# Altium schematic sheet SFY_ADA_4G_02_MODEM_1.SchDoc: MODEM 1/2
size 297 x 209 mm; SPICEModelCacheSIYKSXFI: <root> / <DocumentId>SIYKSXFI</DocumentId> / <CacheFrame Number="0"> / <Model Name="0603_150060gs55040" Kind="CKT"> / <Text>***************************** / .subckt 0603_150060GS55040 1 2 / D1 1 2 SMCD / .MODEL SMCD D / + IS=406.49E-12 / + N=4.8627 / + RS=4.1370 / + IKF=13.914E-6 / + CJO=1.0000E-12 / + M=.3333 / + VJ=.75 / + BV=5 / + IBV=100.00E-6 / + TT=5.0000E-9 / .ends</Text> / </Model> / </CacheFrame> / </root>
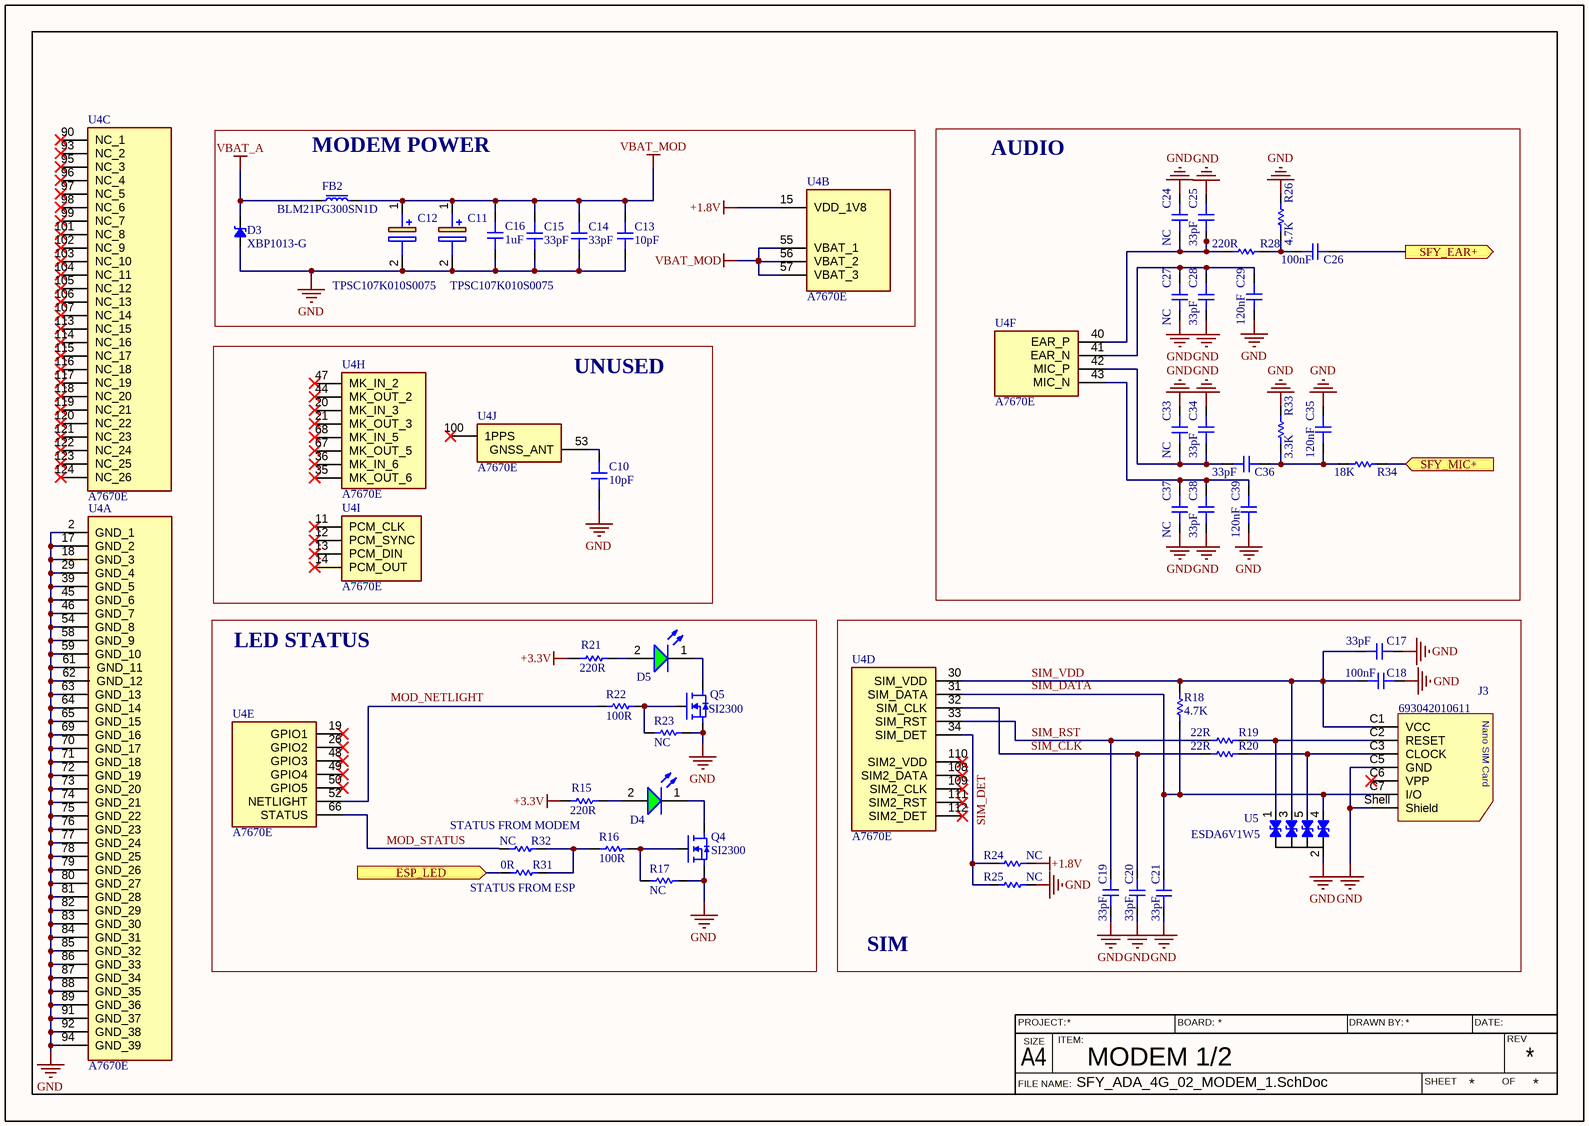
[diagram p0: SFY_ADA_4G_02_MODEM_1.SchDoc]

## Parts
C10  10pF  [C_0603_H_0.8_M]
C11  TPSC107K010S0075  [CAPPM6032X280N]
C12  TPSC107K010S0075  [CAPPM6032X280N]
C13  10pF  [C_0603_H_0.8_M]
C14  33pF  [C_0603_H_0.8_M]
C15  33pF  [C_0603_H_0.8_M]
C16  1uF  [C_0603_H_0.8_M]
C17  33pF  [C_0603_H_0.8_M]
C18  100nF  [C_0603_H_0.8_M]
C19  33pF  [C_0603_H_0.8_M]
C20  33pF  [C_0603_H_0.8_M]
C21  33pF  [C_0603_H_0.8_M]
C24  NC  [C_0603_H_0.8_M]
C25  33pF  [C_0603_H_0.8_M]
C26  100nF  [C_0603_H_0.8_M]
C27  NC  [C_0603_H_0.8_M]
C28  33pF  [C_0603_H_0.8_M]
C29  120nF  [C_0603_H_0.8_M]
C33  NC  [C_0603_H_0.8_M]
C34  33pF  [C_0603_H_0.8_M]
C35  120nF  [C_0603_H_0.8_M]
C36  33pF  [C_0603_H_0.8_M]
C37  NC  [C_0603_H_0.8_M]
C38  33pF  [C_0603_H_0.8_M]
C39  120nF  [C_0603_H_0.8_M]
D3  XBP1013-G  [SOD-323-2]
D4  Green, 3.2V, 140°  [WL-SMCD_0603]  (value not drawn)
D5  Green, 3.2V, 140°  [WL-SMCD_0603]  (value not drawn)
FB2  BLM21PG300SN1D  [F_0805_H_1.1_M]
J3  693042010611  [693042010611]
Q4  SI2300  [SOT23-3]
Q5  SI2300  [SOT23-3]
R15  220R  [R_0603_H_0.45_M]
R16  100R  [R_0603_H_0.45_M]
R17  NC  [R_0603_H_0.45_M]
R18  4.7K  [R_0603_H_0.45_M]
R19  22R  [R_0603_H_0.45_M]
R20  22R  [R_0603_H_0.45_M]
R21  220R  [R_0603_H_0.45_M]
R22  100R  [R_0603_H_0.45_M]
R23  NC  [R_0603_H_0.45_M]
R24  NC  [R_0603_H_0.45_M]
R25  NC  [R_0603_H_0.45_M]
R26  4.7K  [R_0603_H_0.45_M]
R28  220R  [R_0603_H_0.45_M]
R31  0R  [R_0603_H_0.45_M]
R32  NC  [R_0603_H_0.45_M]
R33  3.3K  [R_0603_H_0.45_M]
R34  18K  [R_0603_H_0.45_M]
U4  A7670E  [A7670CLNSC]  (parts A,B,C,D,E,F,H,I,J of 12)
U5  ESDA6V1W5  [SOT65P210X110-5N]

## Blocks framed on the sheet
MODEM POWER: C11-C16 D3 FB2 U4
AUDIO: C24-C29 C33-C39 R26 R28 R33 R34 U4
UNUSED: C10 U4
LED STATUS: D4 D5 Q4 Q5 R15-R17 R21-R23 R31 R32 U4
SIM: C17-C21 J3 R18-R20 R24 R25 U4 U5

## Ports
ESP_LED (in, see 01_ESP[5C]), SFY_EAR+ (out, see 00_CHG_POWER[2A]), SFY_MIC+ (in, see 00_CHG_POWER[2A])

## Nets
+1.8V: R24.1 U4.15(VDD_1V8)
+3.3V: R15.1 R21.1
GND: C10.1 C11.2(-) C12.2(-) C13.1 C14.1 C15.1 C16.1 C17.2 C18.2 C19.1 C20.1 C21.2 C24.1 C25.1 C27.2 C28.2 C29.2 C33.1 C34.1 C35.1 C37.2 C38.2 C39.2 D3.1(A) J3.C5(GND) J3.Shell(Shield) Q4.2(S) Q5.2(S) R17.2 R23.2 R25.1 R26.1 R33.1 U4.2(GND_1) U4.17(GND_2) U4.18(GND_3) U4.29(GND_4) U4.39(GND_5) U4.45(GND_6) U4.46(GND_7) U4.54(GND_8) U4.58(GND_9) U4.59(GND_10) U4.61(GND_11) U4.62(GND_12) U4.63(GND_13) U4.64(GND_14) U4.65(GND_15) U4.69(GND_16) U4.70(GND_17) U4.71(GND_18) U4.72(GND_19) U4.73(GND_20) U4.74(GND_21) U4.75(GND_22) U4.76(GND_23) U4.77(GND_24) U4.78(GND_25) U4.79(GND_26) U4.80(GND_27) U4.81(GND_28) U4.82(GND_29) U4.83(GND_30) U4.84(GND_31) U4.85(GND_32) U4.86(GND_33) U4.87(GND_34) U4.88(GND_35) U4.89(GND_36) U4.91(GND_37) U4.92(GND_38) U4.94(GND_39) U5.2(COM_A)
VBAT_A: D3.2(K) FB2.2
VBAT_MOD: C11.1(+) C12.1(+) C13.2 C14.2 C15.2 C16.2 FB2.1 U4.55(VBAT_1) U4.56(VBAT_2) U4.57(VBAT_3)
ESP_LED: R31.1 ; port ESP_LED
MOD_STATUS: R32.1 U4.66(STATUS)
SFY_EAR+: C26.1 ; port SFY_EAR+
SFY_MIC+: R34.2 ; port SFY_MIC+
SIM_CLK: C20.2 R20.1 U4.32(SIM_CLK)
SIM_DET: R24.2 R25.2 U4.34(SIM_DET)
SIM_RST: C19.2 R19.1 U4.33(SIM_RST)
SIM_VDD: C17.1 C18.1 J3.C1(VCC) R18.1 U4.30(SIM_VDD) U5.3(K_2)
NetC10_2: C10.2 U4.53(GNSS_ANT)
NetC21_1: C21.1 J3.C7(I/O) R18.2 U4.31(SIM_DATA) U5.4(K_3)
NetC24_2: C24.2 C25.2 R28.2 U4.40(EAR_P)
NetC26_2: C26.2 R26.2 R28.1
NetC27_1: C27.1 C28.1 C29.1 U4.41(EAR_N)
NetC33_2: C33.2 C34.2 C36.1 U4.42(MIC_P)
NetC35_2: C35.2 C36.2 R33.2 R34.1
NetC37_1: C37.1 C38.1 C39.1 U4.43(MIC_N)
NetD4_1: D4.1(K) Q4.3(D)
NetD4_2: D4.2(A) R15.2
NetD5_1: D5.1(K) Q5.3(D)
NetD5_2: D5.2(A) R21.2
NetJ3_C2: J3.C2(RESET) R19.2 U5.1(K_1)
NetJ3_C3: J3.C3(CLOCK) R20.2 U5.5(K_4)
NetQ4_1: Q4.1(G) R16.2 R17.1
NetQ5_1: Q5.1(G) R22.2 R23.1
NetR16_1: R16.1 R31.2 R32.2
NetR22_1: R22.1 U4.52(NETLIGHT)

Not connected (* = marked no-connect by the designer): J3 C6(VPP)*; U4 11(PCM_CLK)* 12(PCM_SYNC)* 13(PCM_DIN)* 14(PCM_OUT)* 19(GPIO1)* 20(MK_IN_3)* 21(MK_OUT_3)* 26(GPIO2)* 35(MK_OUT_6)* 36(MK_IN_6)* 44(MK_OUT_2)* 47(MK_IN_2)* 48(GPIO3)* 49(GPIO4)* 50(GPIO5)* 67(MK_OUT_5)* 68(MK_IN_5)* 90(NC_1)* 93(NC_2)* 95(NC_3)* 96(NC_4)* 97(NC_5)* 98(NC_6)* 99(NC_7)* 100(1PPS)* 101(NC_8)* 102(NC_9)* 103(NC_10)* 104(NC_11)* 105(NC_12)* 106(NC_13)* 107(NC_14)* 108(SIM2_DATA)* 109(SIM2_CLK)* 110(SIM2_VDD)* 111(SIM2_RST)* 112(SIM2_DET)* 113(NC_15)* 114(NC_16)* 115(NC_17)* 116(NC_18)* 117(NC_19)* 118(NC_20)* 119(NC_21)* 120(NC_22)* 121(NC_23)* 122(NC_24)* 123(NC_25)* 124(NC_26)*

## Notes on the sheet
- STATUS FROM MODEM
- (near R31) STATUS FROM ESP
- Labels drawn without touching a wire or pin: MOD_NETLIGHT, SIM_DATA
- FILE NAME:
- PROJECT:
- A4
- SIZE
- ITEM:
- BOARD:
- DRAWN BY:
- SHEET
- DATE:
- OF
- REV

## Library data of the parts
C10 C13-C21 C24-C29 C33-C39 = C: TYPE / TOLERANCE / VOLTAGE / PACKAGE; Symbol_Valid: 20260706; Manufacturer_Name: *; Manufacturer_Ref: *; Keolabs_ref: *
C11 C12 = TPSC107K010S0075: Capacitor Polarised; Manufacturer_Name: Kyocera AVX; Datasheet Link: https://datasheets.kyocera-avx.com/TPS.pdf; Height: 2.8mm; Manufacturer_Part_Number: TPSC107K010S0075; Mouser Part Number: 581-TPSC107K010S0075; Mouser Price/Stock: https://www.mouser.co.uk/ProductDetail/KYOCERA-AVX/TPSC107K010S0075?qs=06QaI1AeGGYXIlSOad5TiA%3D%3D
D3 = D_TVS_UNIDIR: 5V; Symbol_Valid: 20260706; Manufacturer_Name: *; Manufacturer_Ref: *; Keolabs_Ref: *
D4 D5 = 150060GS55040: WL-SMCD Mono-color Chip LED Diffused, SMT, size 0603, Green, 3.2V, 140°; Manufacturer: Wurth Elektronik; Case/Size Code: 0603; Chip Technology: InGaN; Dominant Wavelength: 525nm; Luminous Intensity: 430mcd; Peak Wavelength: 520nm; Manufacturer Part Number: 150060GS55040; Category: Signal LEDs; Match Code: WL-SMCD; ComponentLink1Description: Website Link; ComponentLink1URL: https://www.we-online.com/redexpert/article/150060GS55040?ad; ComponentLink2Description: Datasheet Link; ComponentLink2URL: https://www.we-online.com/redexpert/spec/150060GS55040?ad; Mount: Surface Mount; Operating Temperature Max: 85°C; Operating Temperature Min: -40°C; Packaging: Tape and Reel; Length: 1.6mm; Width: 0.8mm; Height: 0.4mm; Emitting Color: Green; Forward Voltage: 3.2V; Viewing Angle: 140°
FB2 = FB: Symbol_Valid: 20260706; Manufacturer_Name: *; Manufacturer_Ref: *; Keolabs_Ref: *
J3 = 693042010611: WR-CRD SIM Card Connector Hinge Socket, 6 pins; Manufacturer: Wurth Elektronik; Durability: 5000 Mating cycles; Manufacturer Part Number: 693042010611; Category: Input/Output Connector; Match Code: WR-CRD; ComponentLink1Description: Website Link; ComponentLink1URL: https://www.we-online.com/redexpert/article/693042010611?ad; ComponentLink2Description: Datasheet Link; ComponentLink2URL: https://www.we-online.com/redexpert/spec/693042010611?ad; Mount: Surface Mount; Min Operating Temperature: -25 °C; Max Operating Temperature: 85 °C; Packaging: Tape and Reel; Application: Nano SIM Card; Gender: Socket; Number of Pins: 6; Type: Hinge
Q4 Q5 = T_MOS_D_N: CURRENT / VOLTAGE / RDSON / PACKAGE; Symbol_Valid: 20260706; Manufacturer_Name: *; Manufacturer_Ref: *; Keolabs_Ref: *
R15-R26 R28 R31-R34 = R: TOLERANCE / POWER / VOLTAGE / PACKAGE; Symbol_Valid: 20260706; Manufacturer_Name: *; Manufacturer_Ref: *; Keolabs_Ref: *
U4 = A7670E: Integrated Circuit; Manufacturer_Name: SIMCOM; Manufacturer_Part_Number: A7670C-LNSC; Datasheet Link: https://nostris.ee/pdf/A7670%20Series%20Hardware%20Design_V1.00.pdf; Height: 2.77mm
U5 = ESDA6V1W5: Integrated Circuit; Manufacturer_Name: STMicroelectronics; Datasheet Link: https://www.st.com/resource/en/datasheet/esdaxxxwx.pdf; Height: 1.1mm; Manufacturer_Part_Number: ESDA6V1W5; Mouser Part Number: 511-ESDA6V1W5; Mouser Price/Stock: https://www.mouser.co.uk/ProductDetail/STMicroelectronics/ESDA6V1W5?qs=9NrABl3fj%2FrhT5vdkOmqXg%3D%3D; Arrow Part Number: ESDA6V1W5; Arrow Price/Stock: https://www.arrow.com/en/products/esda6v1w5/stmicroelectronics.html?utm_currency=USD&region=nac